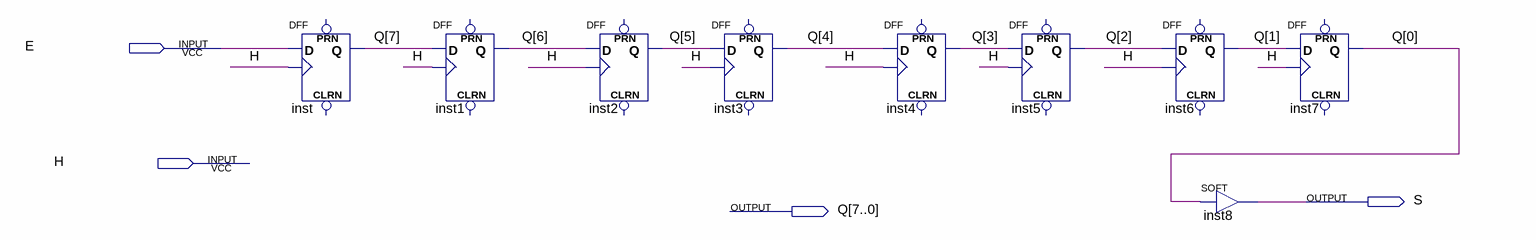
[diagram p0: schematic sheet]
// Quartus schematic Shift8.bdf as structural Verilog: 9 symbols, 4 pins
module Shift8 (
  input  E,
  input  H,
  output S,
  output [7:0] Q
);

  DFF inst (.CLK(H), .D(E), .Q(Q[7]));  // open: CLRN, PRN
  DFF inst1 (.CLK(H), .D(Q[7]), .Q(Q[6]));  // open: CLRN, PRN
  DFF inst2 (.CLK(H), .D(Q[6]), .Q(Q[5]));  // open: CLRN, PRN
  DFF inst3 (.CLK(H), .D(Q[5]), .Q(Q[4]));  // open: CLRN, PRN
  DFF inst4 (.CLK(H), .D(Q[4]), .Q(Q[3]));  // open: CLRN, PRN
  DFF inst5 (.CLK(H), .D(Q[3]), .Q(Q[2]));  // open: CLRN, PRN
  DFF inst6 (.CLK(H), .D(Q[2]), .Q(Q[1]));  // open: CLRN, PRN
  SOFT inst8 (.IN(Q[0]), .OUT(S));
  DFF inst7 (.CLK(H), .D(Q[1]), .Q(Q[0]));  // open: CLRN, PRN
endmodule
